# Altium schematic sheet SplitFlapDriverATtiny1616V4.kicad_pcb.SchDoc
size 297 x 209 mm
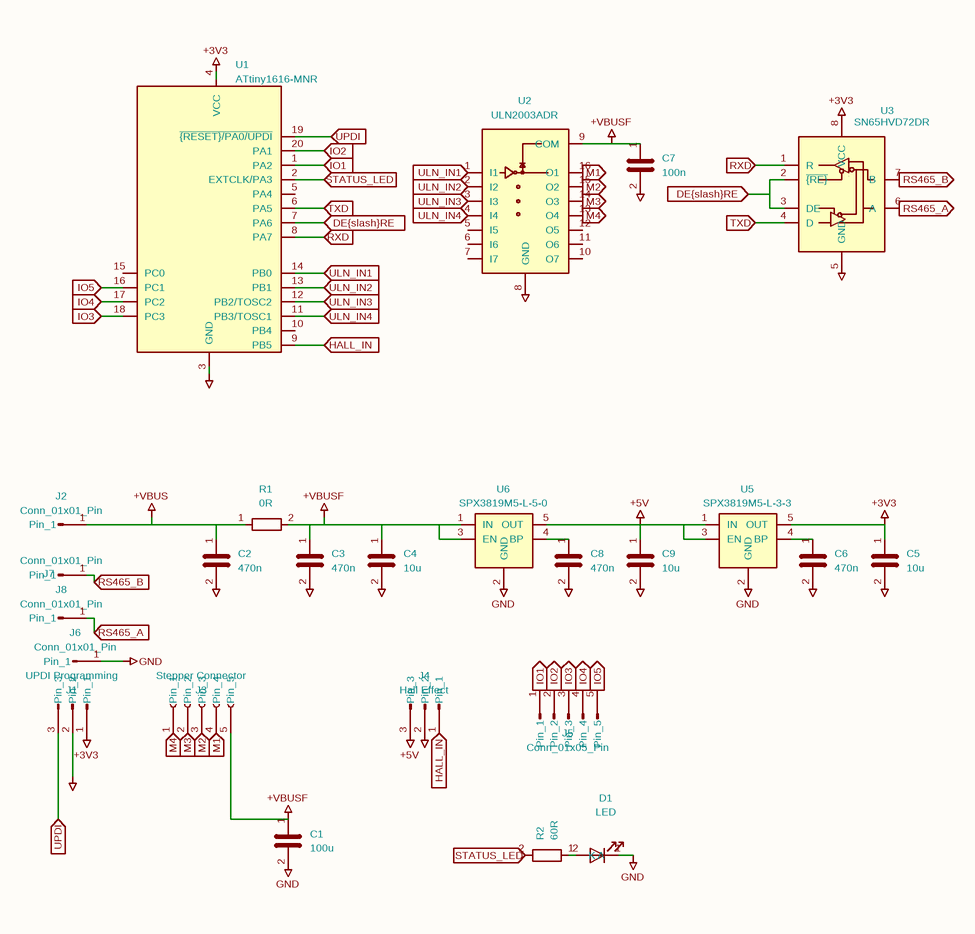
[diagram p0: SplitFlapDriverATtiny1616V4.kicad_pcb.SchDoc]

## Parts
C1  100u  [C_Elec_5x5.4]
C2  470n  [C_0603_1608Metric]
C3  470n  [C_0603_1608Metric]
C4  10u  [C_0603_1608Metric]
C5  10u  [C_0603_1608Metric]
C6  470n  [C_0603_1608Metric]
C7  100n  [C_0603_1608Metric]
C8  470n  [C_0603_1608Metric]
C9  10u  [C_0603_1608Metric]
D1  LED  [LED_0603_1608Metric]
J1  UPDI Programming  [PinHeader_1x03_P2.54mm_Vertical]
J2  Conn_01x01_Pin  [PinHeader_1x01_P2.54mm_Vertical]
J3  Stepper Connector  [JST_XH_B5B-XH-A_1x05_P2.50mm_Vertical]
J4  Hall Effect  [JST_PH_B3B-PH-K_1x03_P2.00mm_Vertical]
J5  Conn_01x05_Pin  [PinHeader_1x05_P2.54mm_Vertical]
J6  Conn_01x01_Pin  [PinHeader_1x01_P2.54mm_Vertical]
J7  Conn_01x01_Pin  [PinHeader_1x01_P2.54mm_Vertical]
J8  Conn_01x01_Pin  [PinHeader_1x01_P2.54mm_Vertical]
R1  0R  [R_0805_2012Metric]
R2  60R  [R_0603_1608Metric]
U1  ATtiny1616-MNR  [VQFN-20-1EP_3x3mm_P0.4mm_EP1.7x1.7mm]
U2  ULN2003ADR  [SOIC-16W_5.3x10.2mm_P1.27mm]
U3  SN65HVD72DR  [SOIC-8_5.3x6.2mm_P1.27mm]
U5  SPX3819M5-L-3-3  [SOT-23-5]
U6  SPX3819M5-L-5-0  [SOT-23-5]

## Ports
DE{slash}RE (in), HALL_IN (in), IO1 (in), IO2 (in), IO3 (in), IO4 (in), IO5 (in), M1 (in), M2 (in), M3 (in), M4 (in), RS465_A (in), RS465_B (in), RXD (in), STATUS_LED (in), TXD (in), ULN_IN1 (in), ULN_IN2 (in), ULN_IN3 (in), ULN_IN4 (in), UPDI (in)

## Nets
+3V3: C5.1 J1.1(Pin_1) U1.4(VCC) U3.8(VCC) U5.5(OUT)
+5V: C9.1 J4.3(Pin_3) U5.1(IN) U5.3(EN) U6.5(OUT)
+VBUS: C2.1 J2.1(Pin_1) R1.1
+VBUSF: C1.1 C3.1 C4.1 C7.1 J3.5(Pin_5) R1.2 U2.9(COM) U6.1(IN) U6.3(EN)
GND: C1.2 C2.2 C3.2 C4.2 C5.2 C6.2 C7.2 C8.2 C9.2 D1.1(K) J1.2(Pin_2) J4.2(Pin_2) J6.1(Pin_1) U1.3(GND) U2.8(GND) U3.5(GND) U5.2(GND) U6.2(GND)
DE{slash}RE: U1.7(PA6) U3.2(~{{RE}}) U3.3(DE) ; port DE{slash}RE
HALL_IN: J4.1(Pin_1) U1.9(PB5) ; port HALL_IN
IO1: J5.1(Pin_1) U1.1(PA2) ; port IO1
IO2: J5.2(Pin_2) U1.20(PA1) ; port IO2
IO3: J5.3(Pin_3) U1.18(PC3) ; port IO3
IO4: J5.4(Pin_4) U1.17(PC2) ; port IO4
IO5: J5.5(Pin_5) U1.16(PC1) ; port IO5
M1: J3.4(Pin_4) U2.16(O1) ; port M1
M2: J3.3(Pin_3) U2.15(O2) ; port M2
M3: J3.2(Pin_2) U2.14(O3) ; port M3
M4: J3.1(Pin_1) U2.13(O4) ; port M4
RS465_A: J8.1(Pin_1) U3.6(A) ; port RS465_A
RS465_B: J7.1(Pin_1) U3.7(B) ; port RS465_B
RXD: U1.8(PA7) U3.1(R) ; port RXD
STATUS_LED: R2.2 U1.2(EXTCLK/PA3) ; port STATUS_LED
TXD: U1.6(PA5) U3.4(D) ; port TXD
ULN_IN1: U1.14(PB0) U2.1(I1) ; port ULN_IN1
ULN_IN2: U1.13(PB1) U2.2(I2) ; port ULN_IN2
ULN_IN3: U1.12(PB2/TOSC2) U2.3(I3) ; port ULN_IN3
ULN_IN4: U1.11(PB3/TOSC1) U2.4(I4) ; port ULN_IN4
UPDI: J1.3(Pin_3) U1.19(~{{RESET}/PA0/UPDI}) ; port UPDI
NetC6_1: C6.1 U5.4(BP)
NetC8_1: C8.1 U6.4(BP)
NetD1_2: D1.2(A) R2.1

Not connected (* = marked no-connect by the designer): U1 5(PA4) 10(PB4) 15(PC0); U2 5(I5) 6(I6) 7(I7) 10(O7) 11(O6) 12(O5)

## Notes on the sheet
- 1
- 2
- 3
- 4
- 5
- 6
- A
- B
- C
- D
- Title:
- File: SplitFlapDriverATtiny1616V4.kicad_pcb.kicad_sch
- Sheet: /
- KiCad E.D.A.  kicad (5.1.4)-1
- Size: A4
- Date:
- Rev:
- Id: 1/1

## Library data of the parts
C1-C9 = C: Description: Unpolarized capacitor
  C1: Value: 100u; Footprint: Capacitor_SMD:C_Elec_5x5.4
  C2 C3 C6 C8: Value: 470n; Footprint: Capacitor_SMD:C_0603_1608Metric
  C4 C5 C9: Value: 10u; Footprint: Capacitor_SMD:C_0603_1608Metric
  C7: Value: 100n; Footprint: Capacitor_SMD:C_0603_1608Metric
D1 = LED: Description: Light emitting diode; Sim.Pins: 1=K 2=A; Value: LED; Footprint: LED_SMD:LED_0603_1608Metric
J1 J4 = Conn_01x03_Pin: Description: Generic connector, single row, 01x03, script generated
  J1: Value: UPDI Programming; Footprint: Connector_PinHeader_2.54mm:PinHeader_1x03_P2.54mm_Vertical
  J4: Value: Hall Effect; Footprint: Connector_JST:JST_PH_B3B-PH-K_1x03_P2.00mm_Vertical
J2 J6-J8 = Conn_01x01_Pin: Description: Generic connector, single row, 01x01, script generated; Value: Conn_01x01_Pin; Footprint: Connector_PinHeader_2.54mm:PinHeader_1x01_P2.54mm_Vertical
J3 = Conn_01x05_Socket: Description: Generic connector, single row, 01x05, script generated; Value: Stepper Connector; Footprint: Connector_JST:JST_XH_B5B-XH-A_1x05_P2.50mm_Vertical
J5 = Conn_01x05_Pin: Description: Generic connector, single row, 01x05, script generated; Value: Conn_01x05_Pin; Footprint: Connector_PinHeader_2.54mm:PinHeader_1x05_P2.54mm_Vertical
R1 R2 = R: Description: Resistor
  R1: Value: 0R; Footprint: Resistor_SMD:R_0805_2012Metric
  R2: Value: 60R; Footprint: Resistor_SMD:R_0603_1608Metric
U1 = ATtiny1616-MNR: Manufacturer: Microchip Tech; Description: 20MHz, 16kB Flash, 2kB SRAM, 256B EEPROM, SOIC-20; Manufacturer Part Number: ATTINY1616-MNR; JLCPCB Part Number: C507118; Value: ATtiny1616-MNR; Footprint: Package_DFN_QFN:VQFN-20-1EP_3x3mm_P0.4mm_EP1.7x1.7mm
U2 = ULN2003ADR: Manufacturer: Texas Instruments; Description: High Voltage, High Current Darlington Transistor Arrays, SOIC16/SOIC16W/DIP16/TSSOP16; Manufacturer Part Number: ULN2003ADR; JLCPCB Part Number: C7512; Value: ULN2003ADR; Footprint: Package_SO:SOIC-16W_5.3x10.2mm_P1.27mm
U3 = SN65HVD72DR: Manufacturer: Texas Instruments; Description: 3.3V, RS-485 Transceiver, SOIC-8; Manufacturer Part Number: SN65HVD72DR; JLCPCB Part Number: C48125; Value: SN65HVD72DR; Footprint: Package_SO:SOIC-8_5.3x6.2mm_P1.27mm
U5 = SPX3819M5-L-3-3: Description: 500mA Low drop-out regulator, Fixed Output 3.3V, SOT-23-5; Value: SPX3819M5-L-3-3; Footprint: Package_TO_SOT_SMD:SOT-23-5
U6 = SPX3819M5-L-5-0: Description: 500mA Low drop-out regulator, Fixed Output 5.0V, SOT-23-5; Value: SPX3819M5-L-5-0; Footprint: Package_TO_SOT_SMD:SOT-23-5